# Altium schematic sheet Block_Payload.SchDoc
size B; SheetNumber: 2; SheetTotal: 5
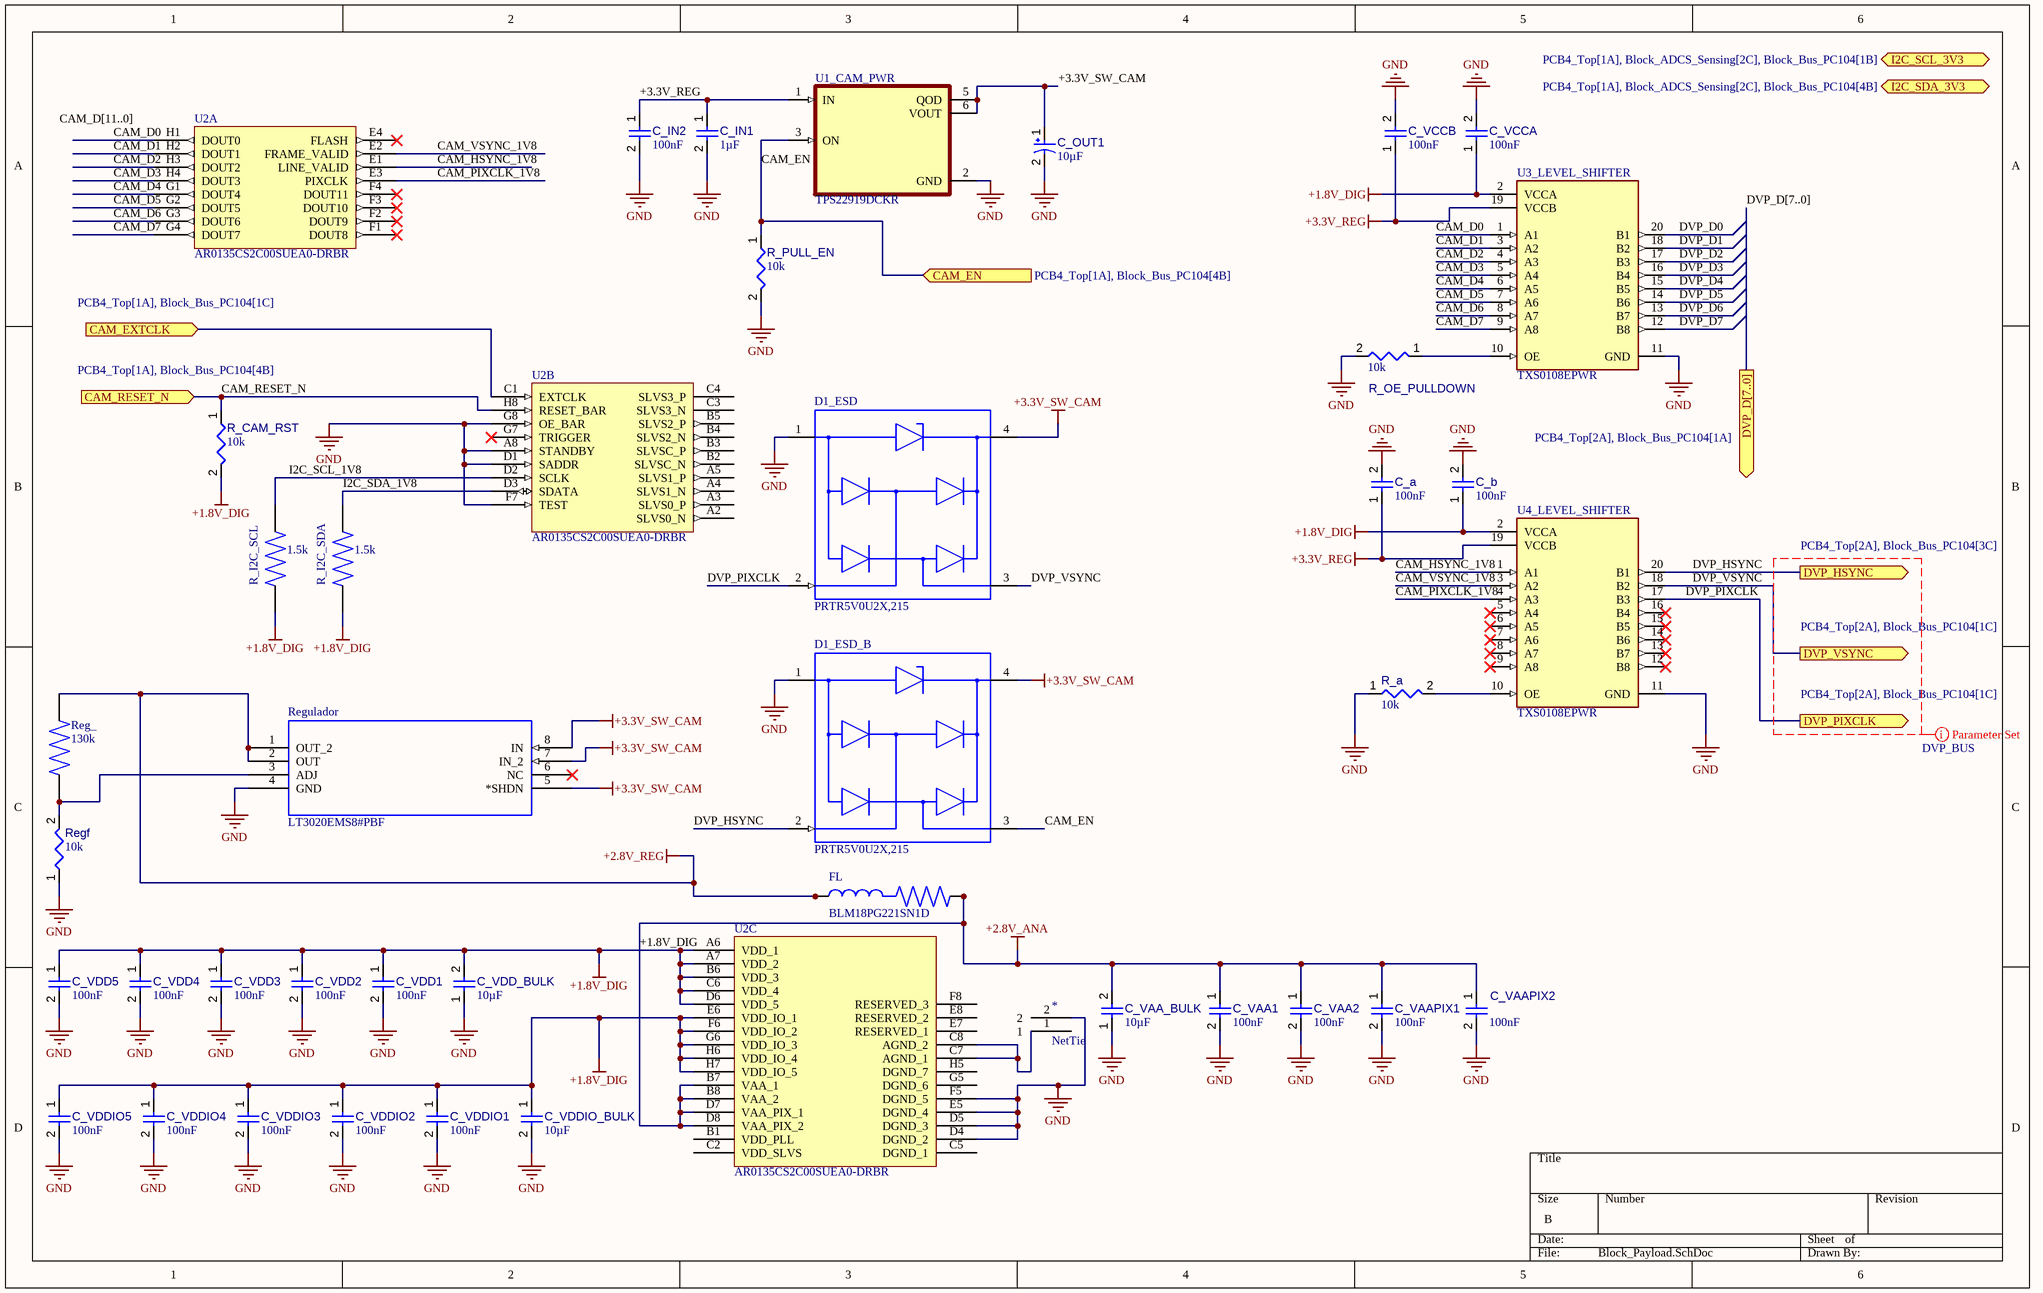
[diagram p0: Block_Payload.SchDoc]

## Parts
*  NetTie  [NetTie]  (net tie, no BOM)
C_a  value 100nF  [CAPC1608X90X40NL10T20]  (hidden comment: Capacitor 100 nF +/-10% 50 V 0603)
C_b  value 100nF  [CAPC1608X90X40NL10T20]  (hidden comment: Capacitor 100 nF +/-10% 50 V 0603)
C_IN1  value 1µF  [CAPC2013X145X50ML20T25]  (hidden comment: Capacitor 1 uF +/- 10% 25 V 0805)
C_IN2  value 100nF  [CAPC1608X90X40NL10T20]  (hidden comment: Capacitor 100 nF +/-10% 50 V 0603)
C_OUT1  value 10µF  [VISH-TR3-A_V]  (hidden comment: TR3A106K016C1700)
C_VAA1  value 100nF  [CAPC0402(1005)60_L]  (hidden comment: Capacitor 100nF +/-20% 10V 0402)
C_VAA2  value 100nF  [CAPC0402(1005)60_L]  (hidden comment: Capacitor 100nF +/-20% 10V 0402)
C_VAA_BULK  value 10µF  [CAPC2013X135X45NL10T25]  (hidden comment: Capacitor 10 uF +/- 10% 16 V 0805)
C_VAAPIX1  value 100nF  [CAPC0402(1005)60_L]  (hidden comment: Capacitor 100nF +/-20% 10V 0402)
C_VAAPIX2  value 100nF  [CAPC0402(1005)60_L]  (hidden comment: Capacitor 100nF +/-20% 10V 0402)
C_VCCA  value 100nF  [CAPC1608X90X40NL10T20]  (hidden comment: Capacitor 100 nF +/-10% 50 V 0603)
C_VCCB  value 100nF  [CAPC1608X90X40NL10T20]  (hidden comment: Capacitor 100 nF +/-10% 50 V 0603)
C_VDD1  value 100nF  [CAPC0402(1005)60_L]  (hidden comment: Capacitor 100nF +/-20% 10V 0402)
C_VDD2  value 100nF  [CAPC0402(1005)60_L]  (hidden comment: Capacitor 100nF +/-20% 10V 0402)
C_VDD3  value 100nF  [CAPC0402(1005)60_L]  (hidden comment: Capacitor 100nF +/-20% 10V 0402)
C_VDD4  value 100nF  [CAPC0402(1005)60_L]  (hidden comment: Capacitor 100nF +/-20% 10V 0402)
C_VDD5  value 100nF  [CAPC0402(1005)60_L]  (hidden comment: Capacitor 100nF +/-20% 10V 0402)
C_VDD_BULK  value 10µF  [CAPC2013X135X45NL10T25]  (hidden comment: Capacitor 10 uF +/- 10% 16 V 0805)
C_VDDIO1  value 100nF  [CAPC0402(1005)60_L]  (hidden comment: Capacitor 100nF +/-20% 10V 0402)
C_VDDIO2  value 100nF  [CAPC0402(1005)60_L]  (hidden comment: Capacitor 100nF +/-20% 10V 0402)
C_VDDIO3  value 100nF  [CAPC0402(1005)60_L]  (hidden comment: Capacitor 100nF +/-20% 10V 0402)
C_VDDIO4  value 100nF  [CAPC0402(1005)60_L]  (hidden comment: Capacitor 100nF +/-20% 10V 0402)
C_VDDIO5  value 100nF  [CAPC0402(1005)60_L]  (hidden comment: Capacitor 100nF +/-20% 10V 0402)
C_VDDIO_BULK  value 10µF  [CAPC2013X135X45NL10T25]  (hidden comment: Capacitor 10 uF +/- 10% 16 V 0805)
D1_ESD  PRTR5V0U2X,215  [FP-SOT143B-MFG]
D1_ESD_B  PRTR5V0U2X,215  [FP-SOT143B-MFG]
FL  BLM18PG221SN1D  [BEADC1608X95N]
R_a  value 10k  [RESC1608X55X25ML10T15]  (hidden comment: Resistor 10k +/-1% 0603 100 mW)
R_CAM_RST  value 10k  [RESC1608X55X25ML10T15]  (hidden comment: Resistor 10k +/-1% 0603 100 mW)
R_I2C_SCL  1.5k  [RES_ERA3ARB152V]
R_I2C_SDA  1.5k  [RES_ERA3ARB152V]
R_OE_PULLDOWN  value 10k  [RESC1608X55X25ML10T15]  (hidden comment: Resistor 10k +/-1% 0603 100 mW)
R_PULL_EN  value 10k  [RESC1608X55X25ML10T15]  (hidden comment: Resistor 10k +/-1% 0603 100 mW)
Reg_  130k  [RESC1608X55N]
Regf  value 10k  [RESC1608X55X25ML10T15]  (hidden comment: Resistor 10k +/-1% 0603 100 mW)
Regulador  LT3020EMS8#PBF  [MSOP-8_MS]
U1_CAM_PWR  TPS22919DCKR  [SOT65P210X110-6N]
U2  AR0135CS2C00SUEA0-DRBR  [BGA63C100P8X8_900X900X144N]  (parts A,B,C of 3)
U3_LEVEL_SHIFTER  TXS0108EPWR  [FP-PW0020A-IPC_A]
U4_LEVEL_SHIFTER  TXS0108EPWR  [FP-PW0020A-IPC_A]

## Ports
CAM_EN (in, see PCB4_Top[1A], Block_Bus_PC104[4B]), CAM_EXTCLK (in, see PCB4_Top[1A], Block_Bus_PC104[1C]), CAM_RESET_N (in, see PCB4_Top[1A], Block_Bus_PC104[4B]), DVP_D[7..0] (out, see PCB4_Top[2A], Block_Bus_PC104[1A]), DVP_HSYNC (out, see PCB4_Top[2A], Block_Bus_PC104[3C]), DVP_PIXCLK (out, see PCB4_Top[2A], Block_Bus_PC104[1C]), DVP_VSYNC (out, see PCB4_Top[2A], Block_Bus_PC104[1C]), I2C_SCL_3V3 (bidir, see PCB4_Top[1A], Block_ADCS_Sensing[2C], Block_Bus_PC104[1B]), I2C_SDA_3V3 (bidir, see PCB4_Top[1A], Block_ADCS_Sensing[2C], Block_Bus_PC104[4B])

## Nets
+1.8V_DIG: C_b.1 C_VAA1.1 C_VAA2.1 C_VAA_BULK.2 C_VAAPIX1.1 C_VAAPIX2.1 C_VCCA.1 C_VDD1.1 C_VDD2.1 C_VDD3.1 C_VDD4.1 C_VDD5.1 C_VDD_BULK.2 C_VDDIO1.1 C_VDDIO2.1 C_VDDIO3.1 C_VDDIO4.1 C_VDDIO5.1 C_VDDIO_BULK.1 FL.2 R_CAM_RST.2 R_I2C_SCL.1 R_I2C_SDA.1 U2.A6(VDD_1) U2.A7(VDD_2) U2.B6(VDD_3) U2.B7(VAA_1) U2.B8(VAA_2) U2.C6(VDD_4) U2.D6(VDD_5) U2.D7(VAA_PIX_1) U2.D8(VAA_PIX_2) U2.E6(VDD_IO_1) U2.F6(VDD_IO_2) U2.G6(VDD_IO_3) U2.H6(VDD_IO_4) U2.H7(VDD_IO_5) U3_LEVEL_SHIFTER.2(VCCA) U4_LEVEL_SHIFTER.2(VCCA)  [also labelled +2.8V_ANA]
+2.8V_REG: FL.1 Reg_.2 Regulador.1(OUT_2) Regulador.2(OUT)
+3.3V_REG: C_a.1 C_IN1.1 C_IN2.1 C_VCCB.1 U1_CAM_PWR.1(IN) U3_LEVEL_SHIFTER.19(VCCB) U4_LEVEL_SHIFTER.19(VCCB)
+3.3V_SW_CAM: C_OUT1.1 D1_ESD.4(VCC) D1_ESD_B.4(VCC) Regulador.5(*SHDN) Regulador.7(IN_2) Regulador.8(IN) U1_CAM_PWR.5(QOD) U1_CAM_PWR.6(VOUT)
GND: *.2 C_a.2 C_b.2 C_IN1.2 C_IN2.2 C_OUT1.2 C_VAA1.2 C_VAA2.2 C_VAA_BULK.1 C_VAAPIX1.2 C_VAAPIX2.2 C_VCCA.2 C_VCCB.2 C_VDD1.2 C_VDD2.2 C_VDD3.2 C_VDD4.2 C_VDD5.2 C_VDD_BULK.1 C_VDDIO1.2 C_VDDIO2.2 C_VDDIO3.2 C_VDDIO4.2 C_VDDIO5.2 C_VDDIO_BULK.2 D1_ESD.1(GND) D1_ESD_B.1(GND) R_a.1 R_OE_PULLDOWN.2 R_PULL_EN.2 Regf.1 Regulador.4(GND) U1_CAM_PWR.2(GND) U2.A8(STANDBY) U2.D1(SADDR) U2.D4(DGND_2) U2.D5(DGND_3) U2.E5(DGND_4) U2.F5(DGND_5) U2.F7(TEST) U2.G8(OE_BAR) U3_LEVEL_SHIFTER.11(GND) U4_LEVEL_SHIFTER.11(GND)
CAM_D0: U2.H1(DOUT0) U3_LEVEL_SHIFTER.1(A1)
CAM_D1: U2.H2(DOUT1) U3_LEVEL_SHIFTER.3(A2)
CAM_D2: U2.H3(DOUT2) U3_LEVEL_SHIFTER.4(A3)
CAM_D3: U2.H4(DOUT3) U3_LEVEL_SHIFTER.5(A4)
CAM_D4: U2.G1(DOUT4) U3_LEVEL_SHIFTER.6(A5)
CAM_D5: U2.G2(DOUT5) U3_LEVEL_SHIFTER.7(A6)
CAM_D6: U2.G3(DOUT6) U3_LEVEL_SHIFTER.8(A7)
CAM_D7: U2.G4(DOUT7) U3_LEVEL_SHIFTER.9(A8)
CAM_EN: D1_ESD_B.3(I/O_2) R_PULL_EN.1 U1_CAM_PWR.3(ON) ; port CAM_EN
CAM_EXTCLK: U2.C1(EXTCLK) ; port CAM_EXTCLK
CAM_HSYNC_1V8: U2.E1(LINE_VALID) U4_LEVEL_SHIFTER.1(A1)
CAM_PIXCLK_1V8: U2.E3(PIXCLK) U4_LEVEL_SHIFTER.4(A3)
CAM_RESET_N: R_CAM_RST.1 U2.H8(RESET_BAR) ; port CAM_RESET_N
CAM_VSYNC_1V8: U2.E2(FRAME_VALID) U4_LEVEL_SHIFTER.3(A2)
DVP_D0: U3_LEVEL_SHIFTER.20(B1)
DVP_D1: U3_LEVEL_SHIFTER.18(B2)
DVP_D2: U3_LEVEL_SHIFTER.17(B3)
DVP_D3: U3_LEVEL_SHIFTER.16(B4)
DVP_D4: U3_LEVEL_SHIFTER.15(B5)
DVP_D5: U3_LEVEL_SHIFTER.14(B6)
DVP_D6: U3_LEVEL_SHIFTER.13(B7)
DVP_D7: U3_LEVEL_SHIFTER.12(B8)
DVP_HSYNC: D1_ESD_B.2(I/O_1) U4_LEVEL_SHIFTER.20(B1) ; port DVP_HSYNC
DVP_PIXCLK: D1_ESD.2(I/O_1) U4_LEVEL_SHIFTER.17(B3) ; port DVP_PIXCLK
DVP_VSYNC: D1_ESD.3(I/O_2) U4_LEVEL_SHIFTER.18(B2) ; port DVP_VSYNC
I2C_SCL_1V8: R_I2C_SCL.2 U2.D2(SCLK)
I2C_SDA_1V8: R_I2C_SDA.2 U2.D3(SDATA)
NetR_a_2: R_a.2 U4_LEVEL_SHIFTER.10(OE)
NetR_OE_PULLDOWN_1: R_OE_PULLDOWN.1 U3_LEVEL_SHIFTER.10(OE)
NetReg__1: Reg_.1 Regf.2 Regulador.3(ADJ)
NetU2_C7: U2.C7(AGND_1) U2.C8(AGND_2)

Not connected (* = marked no-connect by the designer): * 1; Regulador 6(NC)*; U2 A2(SLVS0_N) A3(SLVS0_P) A4(SLVS1_N) A5(SLVS1_P) B1(VDD_PLL) B2(SLVSC_N) B3(SLVSC_P) B4(SLVS2_N) B5(SLVS2_P) C2(VDD_SLVS) C3(SLVS3_N) C4(SLVS3_P) C5(DGND_1) E4(FLASH)* E7(RESERVED_1) E8(RESERVED_2) F1(DOUT8)* F2(DOUT9)* F3(DOUT10)* F4(DOUT11)* F8(RESERVED_3) G5(DGND_6) G7(TRIGGER)* H5(DGND_7); U4_LEVEL_SHIFTER 5(A4)* 6(A5)* 7(A6)* 8(A7)* 9(A8)* 12(B8)* 13(B7)* 14(B6)* 15(B5)* 16(B4)*

## Buses and harness runs
bus CAM_D[11..0]
bus DVP_D[7..0] = port DVP_D[7..0]

## Layout directives
net class DVP_BUS; rule Matched Net Lengths [Tolerance = 2mm]: (no net found under the mark)

## Notes on the sheet
- Labels drawn without touching a wire or pin: CAM_D[11..0]

## Library data of the parts
C_a C_b C_IN2 C_VCCA C_VCCB = CMP-001-00017-6: Chip Capacitor, 100 nF, +/- 10%, 50 V, 0603 (1608 Metric); Voltage Rating: 50V; Capacitor Type: Ceramic; Tolerance: 10%; Mounting Technology: SM; Max Operating Temperature: 125°C; RoHS Compliant: True; Pins: 2; Case/Package: 0603; Min Operating Temperature: -55°C
C_IN1 = CMP-001-00010-6: Chip Capacitor, 1 uF, +/-10%, 25 V, 0805 (2012 Metric); Capacitor Type: Ceramic; Voltage Rating: 25V; RoHS Compliant: True; Pins: 2; Mounting Technology: SM; Max Operating Temperature: 125°C; Min Operating Temperature: -55°C; Tolerance: 10%; Case/Package: 0805
C_OUT1 = CMP-001-00049-7: Solid Tantalum Surface Mount Chip Capacitor, TANTAMOUNT(TM), Molded Case, Low ESR, 10 uF, +/- 10%, 16 V, -55 to 125 degC, 1206 (3216 Metric), RoHS, Tape and Reel; Manufacturer: Vishay Semiconductor; Voltage Rating: 16V; Mounting Technology: SM; Case/Package: TR3-A; Datasheet URL: http://www.vishay.com/docs/40080/tr3.pdf; Datasheet Version: Aug-16; RoHS Compliant: Unknown; Manufacturer URL: http://www.vishay.com/; Min Operating Temperature: -55°C; Tolerance: 10%; Max Operating Temperature: 125°C; Package Reference: TR3-A; Capacitor Type: Tantalum; Packaging: TapeandReel; Package Description: 2-Pin Surface Mount Device, Body 3.2 x 1.6 mm
C_VAA1 C_VAA2 C_VAAPIX1 C_VAAPIX2 C_VDD1-C_VDD5 C_VDDIO1-C_VDDIO5 = CMP-001-00061-3: Chip Capacitor, 100nF +/-20%, 10V, 0402, Thickness 0.6 mm; Tolerance: 20%; Mounting Technology: SMT; Voltage Rating: 10V; Max Operating Temperature: 85°C; Pins: 2; Case/Package: 0402; Min Operating Temperature: -55°C
C_VAA_BULK C_VDD_BULK C_VDDIO_BULK = CMP-001-00015-6: Chip Capacitor, 10 uF, +/- 10%, 16 V, 0805 (2012 Metric); Voltage Rating: 16V; Capacitor Type: Ceramic; RoHS Compliant: True; Max Operating Temperature: 85°C; Min Operating Temperature: -55°C; Mounting Technology: SM; Tolerance: 10%; Case/Package: 0805; Pins: 2
D1_ESD D1_ESD_B = CMP-14436-000007-1: TVS DIODE 5.5V SOT143B; Manufacturer: Nexperia; Manufacturer Part Number: PRTR5V0U2X,215
FL = BLM18PG221SN1D: MF: Murata; MP: BLM18PG221SN1D; Value: *; Availability: Unavailable; SnapEDA_Link: https://www.snapeda.com/parts/BLM18PG221SN1D/Murata/view-part/236838/?ref=snap; Price: None; Package: 1608 Murata
R_a R_CAM_RST R_OE_PULLDOWN R_PULL_EN Regf = CMP-009-00017-5: Chip Resistor, 10 KOhm, +/- 1%, 01 W, -55 to 155 degC, 0603 (1608 Metric); Voltage Rating: 50V; Power: 100mW; RoHS Compliant: True; Min Operating Temperature: -55°C; Pins: 2; Case/Package: 0603; Mounting Technology: SM; Max Operating Temperature: 155°C; Tolerance: 1%
R_I2C_SCL R_I2C_SDA = ERA3ARB152V: RES SMD 1.5K OHM 0.1% 1/10W 0603; MF: Panasonic; MP: ERA-3ARB152V; Package: 1608-2 Panasonic; Price: None; Check_prices: https://www.snapeda.com/parts/ERA-3ARB152V/Panasonic/view-part/?ref=eda; Value: *; SnapEDA_Link: https://www.snapeda.com/parts/ERA-3ARB152V/Panasonic/view-part/?ref=snap; Availability: In Stock; Purchase-URL: https://pricing.snapeda.com/search?q=ERA-3ARB152V&ref=eda
Reg_ = RC0603FR-07130KL: 130 kOhms Â±1% 0.1W, 1/10W Chip Resistor 0603 (1608 Metric) Moisture Resistant Thick Film; MF: Yageo; SnapEDA_Link: https://www.snapeda.com/parts/RC0603FR-07130KL/Yageo/view-part/?ref=snap; Package: 1608 Yageo; Value: *; MP: RC0603FR-07130KL; Check_prices: https://www.snapeda.com/parts/RC0603FR-07130KL/Yageo/view-part/?ref=eda
Regulador = LT3020EMS8#PBF: MF: {'manufacturer': u'Analog Devices Inc.'}; Package: None; Price: None; Value: *; MP: LT3020EMS8#PBF; Availability: Unavailable
U1_CAM_PWR = TPS22919DCKR: 5.5-V, 1.5-A, 90-mÎ© load switch with adj. output discharge; MF: Texas Instruments; SnapEDA_Link: https://www.snapeda.com/parts/TPS22919DCKR/Texas+Instruments/view-part/?ref=snap; Package: SOT-SC70-6 Texas Instruments; Value: *; MP: TPS22919DCKR; Check_prices: https://www.snapeda.com/parts/TPS22919DCKR/Texas+Instruments/view-part/?ref=eda
U2 = AR0135CS2C00SUEA0-DRBR: Manufacturer: ON Semiconductor; Manufacturer Part Number: AR0135CS2C00SUEA0-DRBR; Value: AR0135CS
U3_LEVEL_SHIFTER U4_LEVEL_SHIFTER = CMP-2000-04956-2: IC TRNSLTR BIDIRECTIONAL 20TSSOP; Number of Inputs: 8; Supply Current: 8uA; Low Level Output Current: 50mA; Min Supply Voltage: 1.2V; Quiescent Current: 3uA; Output Type: Voltage; Propagation Delay: 4.8ns; Max Supply Voltage: 5.5V; Output Current: 620uA; Turn-On Delay Time: 312ns; Logic Function: Translator; Data Rate: 60Mbps; Rise Time: 6.3ns; High Level Output Current: -50mA; Number of Pins: 20; Packaging: Tape and Reel; Max Operating Temperature: 85°C; Height: 1.15mm; Nominal Supply Current: 8uA; Termination: SMD/SMT; Lead Free: Lead Free; Package Quantity: 1; Number of Bits: 8; Weight: 0.002716oz; Contact Plating: Gold; Series: -; Width: 4.4mm; Radiation Hardening: No; Mount: Surface Mount; Length: 6.5mm; Case/Package: TSSOP; REACH SVHC: No SVHC; RoHS Compliant: Yes; Min Operating Temperature: -40°C; Number of Channels: 8